# Altium schematic sheet Input.SchDoc
size A; DocumentNumber: 12; SheetNumber: 12; SheetTotal: 14
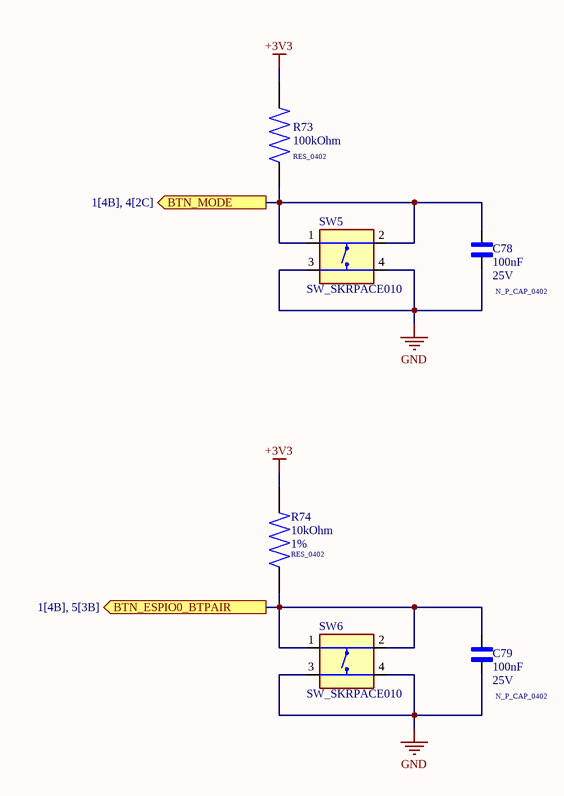
[diagram p0: Input.SchDoc]

## Parts
C78  N_P_CAP_0402  value 100nF  Rated Voltage: 25V  [N_P_CAP_0402]
C79  N_P_CAP_0402  value 100nF  Rated Voltage: 25V  [N_P_CAP_0402]
R73  RES_0402  value 100kOhm  [RES_0402]
R74  RES_0402  value 10kOhm  Tolerance: 1%  [RES_0402]
SW5  SW_SKRPACE010  [SW_SKRPACE010]
SW6  SW_SKRPACE010  [SW_SKRPACE010]

## Ports
BTN_ESPIO0_BTPAIR (out, see 1[4B], 5[3B]), BTN_MODE (out, see 1[4B], 4[2C])

## Nets
+3V3: R73.1 R74.1
GND: C78.1 C79.1 SW5.3 SW5.4 SW6.3 SW6.4
BTN_ESPIO0_BTPAIR: C79.2 R74.2 SW6.1 SW6.2 ; port BTN_ESPIO0_BTPAIR
BTN_MODE: C78.2 R73.2 SW5.1 SW5.2 ; port BTN_MODE

## Library data of the parts
C78 C79 = N_P_CAP: GENERIC NON-POLARIZED CAP; Temperature Coefficient: X7R; LCSC Part Number: C105883; Tolerance: *; MF: *; ESR: *; MPN: *
R73 = RES: GENERIC RES; Tolerance: 1%; Power Rating: *; MPN: *; Rated Voltage: *; Temperature Coefficient: *; LCSC Part Number: C60491
R74 = RES: GENERIC RES; Power Rating: *; MPN: *; Rated Voltage: *; Temperature Coefficient: *; LCSC Part Number: C60490
SW5 SW6 = TACTILE_SWITCH_NO_SPST_4P: GENERIC TACTILE SWITCH NO SPST 4P; MF: ALPS; MPN: SKRPACE010; LCSC Part Number: C139797